# Altium schematic sheet MOD_DRV.SchDoc: AAA
size 431 x 279 mm; Organization: AleskyINC; Address1: ADDRESS 1; Address2: ADDRESS 2; Address3: ADDRESS 3; Address4: ADDRESS 4; Revision: -; SheetNumber: 1; SheetTotal: 5; ENG_APP_DATE: --/--/--; DSN_APP_DATE: --/--/--; CHK_APP_DATE: --/--/--
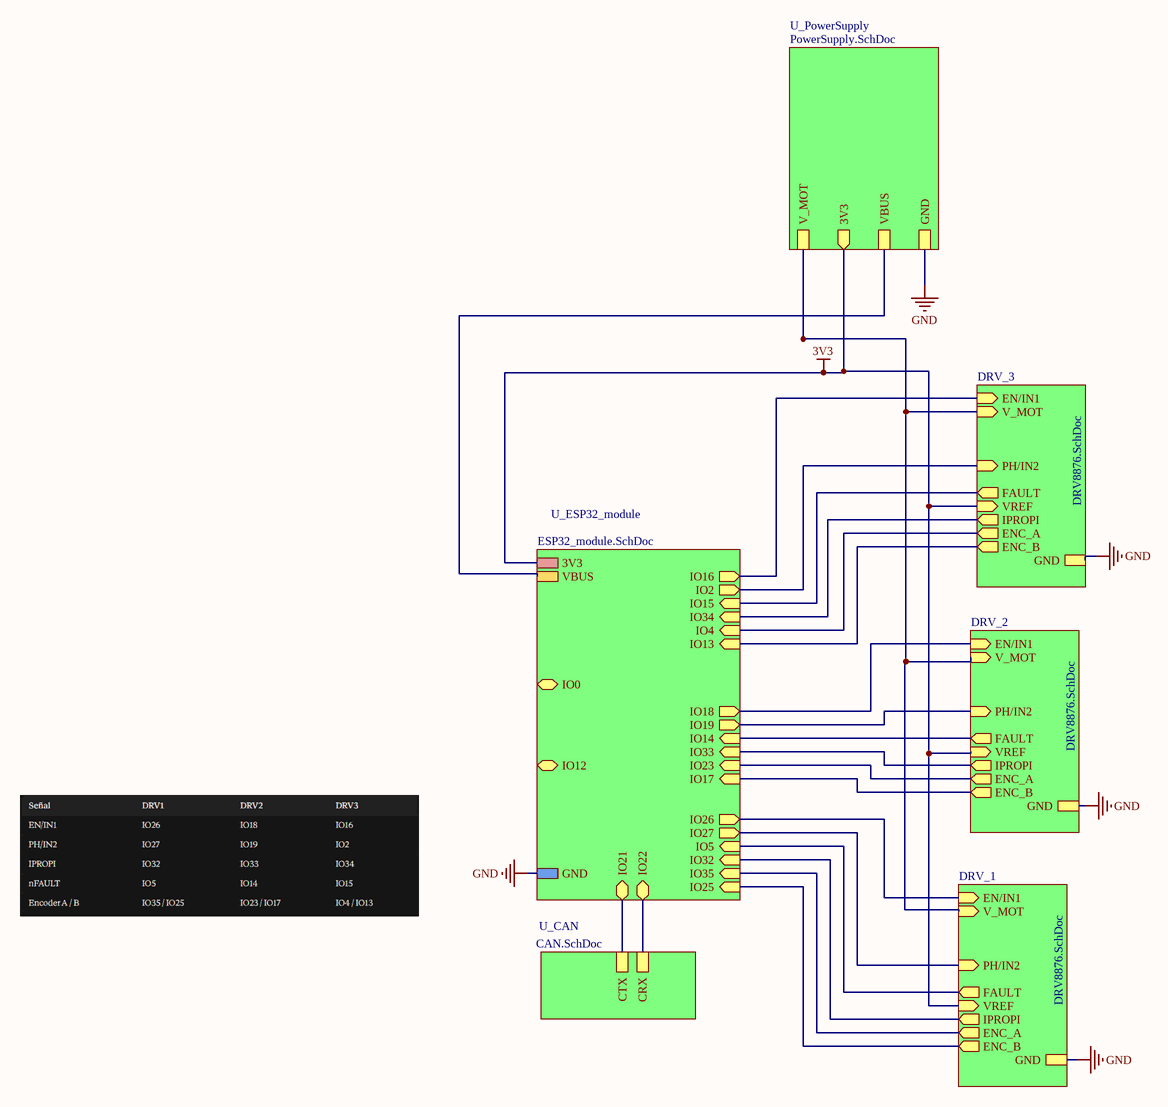
[diagram p0: MOD_DRV.SchDoc]

## Sub-sheets
DRV_1 = DRV8876.SchDoc: EN/IN1 (in), PH/IN2 (in), FAULT (out), IPROPI (out), V_MOT (in), GND, VREF (in), ENC_A (out), ENC_B (out)
DRV_2 = DRV8876.SchDoc: EN/IN1 (in), PH/IN2 (in), FAULT (out), IPROPI (out), V_MOT (in), GND, VREF (in), ENC_A (out), ENC_B (out)
DRV_3 = DRV8876.SchDoc: EN/IN1 (in), PH/IN2 (in), FAULT (out), IPROPI (out), V_MOT (in), GND, VREF (in), ENC_B (out), ENC_A (out)
U_CAN = CAN.SchDoc: CTX, CRX
U_ESP32_module = ESP32_module.SchDoc: IO0 (bidir), IO2 (out), IO4 (in), IO5 (in), IO12 (bidir), IO13 (in), IO14 (in), IO15 (in), IO16 (out), IO17 (in), IO18 (out), IO19 (out), IO21 (bidir), IO22 (bidir), IO23 (in), IO25 (in), IO26 (out), IO27 (out), IO32 (in), IO34 (in), IO35 (in), 3V3, GND, VBUS, IO33 (in)
U_PowerSupply = PowerSupply.SchDoc: V_MOT, 3V3 (out), GND, VBUS

## Nets
3V3: sheet U_ESP32_module/3V3, sheet DRV_3/VREF, sheet DRV_2/VREF, sheet DRV_1/VREF, sheet U_PowerSupply/3V3
GND: sheet U_ESP32_module/GND, sheet DRV_3/GND, sheet DRV_2/GND, sheet DRV_1/GND, sheet U_PowerSupply/GND
(unnamed): sheet U_ESP32_module/IO2, sheet DRV_3/PH/IN2
(unnamed): sheet U_ESP32_module/IO4, sheet DRV_3/ENC_A
(unnamed): sheet U_ESP32_module/IO5, sheet DRV_1/FAULT
(unnamed): sheet U_ESP32_module/IO13, sheet DRV_3/ENC_B
(unnamed): sheet U_ESP32_module/IO14, sheet DRV_2/FAULT
(unnamed): sheet U_ESP32_module/IO15, sheet DRV_3/FAULT
(unnamed): sheet U_ESP32_module/IO16, sheet DRV_3/EN/IN1
(unnamed): sheet U_ESP32_module/IO17, sheet DRV_2/ENC_B
(unnamed): sheet U_ESP32_module/IO18, sheet DRV_2/EN/IN1
(unnamed): sheet U_ESP32_module/IO19, sheet DRV_2/PH/IN2
(unnamed): sheet U_ESP32_module/IO21, sheet U_CAN/CTX
(unnamed): sheet U_ESP32_module/IO22, sheet U_CAN/CRX
(unnamed): sheet U_ESP32_module/IO23, sheet DRV_2/ENC_A
(unnamed): sheet U_ESP32_module/IO25, sheet DRV_1/ENC_B
(unnamed): sheet U_ESP32_module/IO26, sheet DRV_1/EN/IN1
(unnamed): sheet U_ESP32_module/IO27, sheet DRV_1/PH/IN2
(unnamed): sheet U_ESP32_module/IO32, sheet DRV_1/IPROPI
(unnamed): sheet U_ESP32_module/IO34, sheet DRV_3/IPROPI
(unnamed): sheet U_ESP32_module/IO35, sheet DRV_1/ENC_A
(unnamed): sheet U_ESP32_module/VBUS, sheet U_PowerSupply/VBUS
(unnamed): sheet U_ESP32_module/IO33, sheet DRV_2/IPROPI
(unnamed): sheet DRV_3/V_MOT, sheet DRV_2/V_MOT, sheet DRV_1/V_MOT, sheet U_PowerSupply/V_MOT

## Notes on the sheet
- DWG. NO.
- REV.
- SHT.
- THIS DOCUMENT AND THE DATA DISCLOSED HEREIN OR HEREWITH IS THE PROPERTY OF ALTIUM LIMITED AND MAY BE FREELY DISTRIBUTED IN WHOLE. NO RIGHTS ARE RESERVED OR EXPRESS OR IMPLIED WARANTEE GIVEN.
- REVISION
- DESCRIPTION
- DATE
- APPROVED
- ENG:
- APPROVALS
- PROJECT
- DSN:
- CHK:
- REFERENCE DOCUMENTS
- PROJECT REVISION:
- TITLE
- DOCUMENT REVISION:
- DESIGN ITEM:
- BOM:
- FAB DWG:
- PCB DWG:
- ASSY DWG:
- SCALE:
- SIZE
- B
- CAGE CODE
- FILE NAME
- DWG NO.
- SHEET
- OF
- REV